# EasyEDA Pro project curtain-lifter.epro, board PCB3
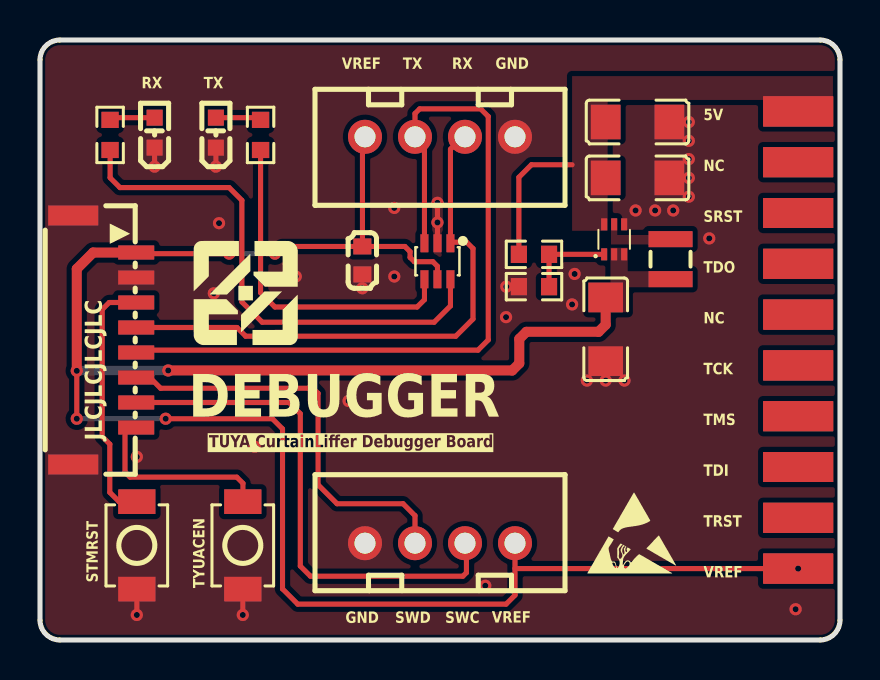
[diagram p6: board, top side]
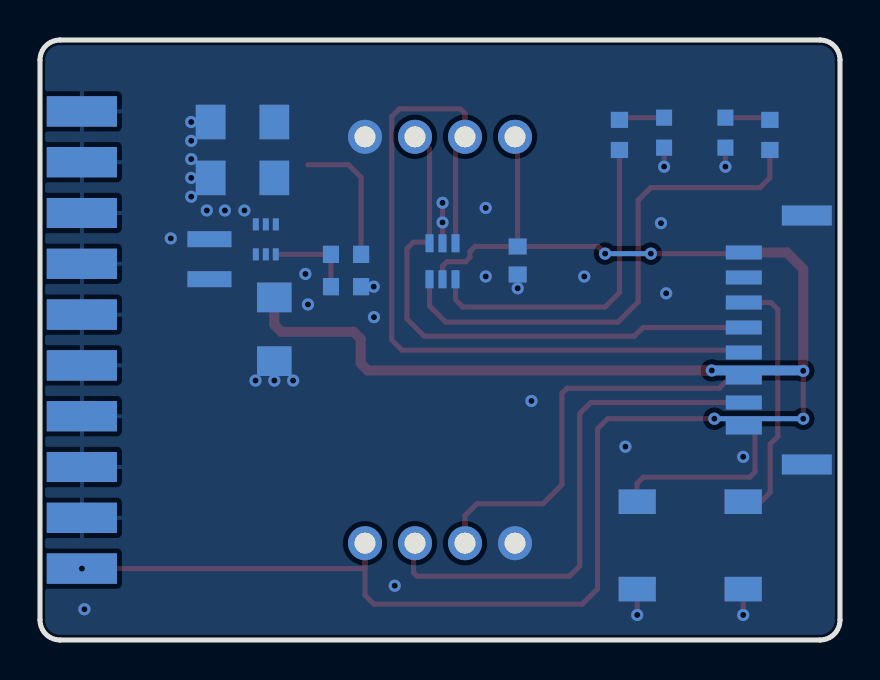
[diagram p7: board, bottom side, seen from below]

Outline 40 x 30 mm; copper layers: Top Layer, Bottom Layer. Coordinates in mm from the lower left corner of the outline.
Outline path: 0,29 0,1 arc(0.29,0.29) 1,0 39,0 arc(39.71,0.29) 40,1 40,29 arc(39.71,29.71) 39,30 1,30 arc(0.29,29.71) 0,29
Stack: Top Layer 0.035mm / Dielectric1 1.51mm FR4 er 4.5 / Bottom Layer 0.035mm

## Design rules (mm)
spacing copperThickness1oz (default): track to track 0.102, other pairs 0.152 to 0.3
spacing copperThickness2oz: track to track 0.203, other pairs 0.152 to 0.3
track width copperThickness1oz (default): min 0.127, default 0.254, max 2.54
track width copperThickness2oz: min 0.203, default 0.254, max 2.54
differential pair differentialPair (default): width min 0.127, default 0.254, max 2.54; gap min 0.152, default 0.152
pour e247 uses copperThickness1oz

## Placement (name value [footprint] x y rotation side)
C1  100nF  [C0603]  16.12 18.98 90 top
C2  10uF  [C1206]  28.28 15.54 270 top
C3  22uF  [C1206]  29.88 25.9 180 top
C24  22uF  [C1206]  29.88 23.11 180 top
CN1  HX-XH2.54-4PZZ  [CONN-TH_4P-P2.50-XH2.54-4P]  20 25.16 0 top
CN2  HX-XH2.54-4PZZ  [CONN-TH_4P-P2.50-XH2.54-4P]  20 4.84 180 top
CN3  SH-SM08B-GHS-TB(LF)(SN)  [CONN-SMD_SH-SM08B-GHS-TB]  3.24 15 270 top
L2  1uH  [IND-SMD_L2.5-W2.0_MHCHL2520]  31.53 19.04 270 top
LED2  XL-1608BGWC-06  [LED-SMD_L1.6-W0.8-RD-BLUE]  8.79 25.37 90 top
LED3  XL-1608BGWC-06  [LED-SMD_L1.6-W0.8-RD-BLUE]  5.73 25.37 90 top
NOREF  -  [Pad_e17]  37.91 6.11 0 top
NOREF#2  -  [Pad_e25]  37.91 18.81 0 top
NOREF#3  -  [Pad_e14]  37.91 13.73 0 top
NOREF#4  -  [Pad_e12]  37.91 18.81 0 top
NOREF#5  -  [Pad_e23]  37.91 26.43 0 top
NOREF#6  -  [Pad_e20]  37.91 6.11 0 top
NOREF#7  -  [Pad_e22]  37.91 3.57 0 top
NOREF#8  -  [Pad_e28]  37.91 11.19 0 top
NOREF#9  -  [Pad_e13]  37.91 16.27 0 top
NOREF#10  -  [Pad_e19]  37.91 13.73 0 top
NOREF#11  -  [Pad_e11]  37.91 21.35 0 top
NOREF#12  -  [Pad_e16]  37.91 8.65 0 top
NOREF#13  -  [Pad_e18]  37.91 3.57 0 top
NOREF#14  -  [Pad_e26]  37.91 21.35 0 top
NOREF#15  -  [Pad_e24]  37.91 16.27 0 top
NOREF#16  -  [Pad_e9]  37.91 26.43 0 top
NOREF#17  -  [Pad_e10]  37.91 23.89 0 top
NOREF#18  -  [Pad_e15]  37.91 11.19 0 top
NOREF#19  -  [Pad_e27]  37.91 23.89 0 top
NOREF#20  -  [Pad_e21]  37.91 8.65 0 top
R1  2kΩ  [R0603]  11.03 25.25 270 top
R2  2kΩ  [R0603]  3.51 25.25 270 top
R3  732kΩ  [R0603]  24.7 19.28 180 top
R4  100kΩ  [R0603]  24.7 17.67 0 top
SW1  TS-1088-AR02016  [SW-SMD_L3.9-W3.0-P4.45]  10.14 4.73 270 top
SW2  TS-1088-AR02016  [SW-SMD_L3.9-W3.0-P4.45]  4.84 4.73 270 top
U1  TPS61023DRLR  [SOT-563_L1.6-W1.2-P0.50-LS1.6-BR]  28.71 20.03 270 top
U8  74LVC2G17GW,125  [SOT-363_L2.0-W1.3-P0.65-LS2.1-BR]  19.87 18.94 90 top

## Footprints (pads in the part's own frame, mm; a bottom-side part is the same pattern mirrored in y, then rotated)
C0603
  rect 0.8x0.9 hole 0.001: 1(-0.7,0) 2(0.7,0)
C1206
  rect 1.485x1.728 hole 0.001: 1(-1.593,0) 2(1.593,0)
CONN-SMD_SH-SM08B-GHS-TB
  rect 0.7x1.8 hole 0.001: 1(-4.375,1.575) 2(-3.125,1.575) 3(-1.875,1.575) 4(-0.625,1.575) 5(0.625,1.575) 6(1.875,1.575) 7(3.125,1.575) 8(4.375,1.575)
  rect 1x2.5 hole 0.001: 9(6.225,-1.575) 10(-6.225,-1.575)
CONN-TH_4P-P2.50-XH2.54-4P
  round 1.7 hole 1.05: 1(3.75,0) 2(1.25,0) 3(-1.25,0) 4(-3.75,0)
IND-SMD_L2.5-W2.0_MHCHL2520
  rect 0.8x2.2 hole 0.001: 1(-1,0) 2(1,0)
LED-SMD_L1.6-W0.8-RD-BLUE
  rect 0.8x0.8 hole 0.001: 1(-0.75,0) 2(0.75,0)
Pad_e9
  rect 3.5x1.5 hole 0.001: 1(0,0)
Pad_e10
  rect 3.5x1.5 hole 0.001: 1(0,0)
Pad_e11
  rect 3.5x1.5 hole 0.001: 1(0,0)
Pad_e12
  rect 3.5x1.5 hole 0.001: 1(0,0)
Pad_e13
  rect 3.5x1.5 hole 0.001: 1(0,0)
Pad_e14
  rect 3.5x1.5 hole 0.001: 1(0,0)
Pad_e15
  rect 3.5x1.5 hole 0.001: 1(0,0)
Pad_e16
  rect 3.5x1.5 hole 0.001: 1(0,0)
Pad_e17
  rect 3.5x1.5 hole 0.001: 1(0,0)
Pad_e18
  rect 3.5x1.5 hole 0.001: 1(0,0)
Pad_e19
  rect 3.5x1.5 hole 0.001: 1(0,0)
Pad_e20
  rect 3.5x1.5 hole 0.001: 1(0,0)
Pad_e21
  rect 3.5x1.5 hole 0.001: 1(0,0)
Pad_e22
  rect 3.5x1.5 hole 0.001: 1(0,0)
Pad_e23
  rect 3.5x1.5 hole 0.001: 1(0,0)
Pad_e24
  rect 3.5x1.5 hole 0.001: 1(0,0)
Pad_e25
  rect 3.5x1.5 hole 0.001: 1(0,0)
Pad_e26
  rect 3.5x1.5 hole 0.001: 1(0,0)
Pad_e27
  rect 3.5x1.5 hole 0.001: 1(0,0)
Pad_e28
  rect 3.5x1.5 hole 0.001: 1(0,0)
R0603
  rect 0.806x0.864 hole 0.001: 1(-0.753,0) 2(0.753,0)
SOT-363_L2.0-W1.3-P0.65-LS2.1-BR
  rect 0.9x0.4 hole 0.001: 1(0.9,-0.65) 2(0.9,0) 3(0.9,0.65) 4(-0.9,0.65) 5(-0.9,0) 6(-0.9,-0.65)
SOT-563_L1.6-W1.2-P0.50-LS1.6-BR
  rect 0.6x0.3 hole 0.001: 1(0.75,-0.5) 2(0.75,0) 3(0.75,0.5) 4(-0.75,0.5) 5(-0.75,0) 6(-0.75,-0.5)
SW-SMD_L3.9-W3.0-P4.45
  rect 1.23x1.86 hole 0.001: 1(-2.185,0) 2(2.185,0)

## Nets
As in the schematic, except:
3V3: C1.2 C2.1 CN1.4 CN2.4 CN3.1 L2.2 NOREF#7.1 NOREF#13.1 U1.2 U1.3 U8.5
5V_DEBUG: C3.2 C24.2 NOREF#16.1 R3.2 U1.6
GND: C1.1 C2.2 C3.1 C24.1 CN1.1 CN2.1 CN3.2 CN3.9 CN3.10 LED2.1 LED3.1 NOREF#2.1 NOREF#5.1 NOREF#6.1 NOREF#8.1 NOREF#10.1 NOREF#14.1 NOREF#15.1 NOREF#19.1 NOREF#20.1 R4.1 SW1.2 SW2.2 U1.4 U8.2

Pads without a net: NOREF#9 1; NOREF#17 1

## Via types
v1: diameter 0.61, hole 0.305, Top Layer to Bottom Layer, 40 vias

## Routing (per net, layer and track width the routed paths; a pad name or vN(x,y) marks a point on that pad's centre or on a via; arc(x,y) is an arc through that point)
3V3: length 109.7
  Top Layer w0.254: v1(11.75,19.32) 12.1,19.68 C1.2 18.24,19.68 18.5,19.42 18.5,19.13 18.72,18.92 19.64,18.92 19.87,18.69 U8.5 ; 23.75,3.57 23.75,2.24 23.3,1.79 12.89,1.79 12.13,2.55 12.13,10.56 11.62,11.06 v1(6.28,11.06) ; 23.75,3.57 v1(37.91,3.57) ; 23.75,3.57 CN2.4 ; 16.12,25.3 16.12,19.68 ; v1(1.84,11.06) v1(1.84,13.46) ; v1(9.46,19.32) 4.87,19.32 4.81,19.38
  Top Layer w0.5: 4.81,19.38 2.66,19.38 1.84,18.56 v1(1.84,13.46) ; C2.1 28.28,15.76 27.93,15.41 24.32,15.41 23.96,15.06 23.96,13.83 23.61,13.48 v1(6.41,13.48)
  Bottom Layer w0.254: v1(11.75,19.32) v1(9.46,19.32) ; v1(6.28,11.06) v1(1.84,11.06)
  Bottom Layer w0.5: v1(6.41,13.48) 1.84,13.48
5V_DEBUG: length 6.4
  Top Layer w0.254: 26.6,23.76 24.57,23.76 23.95,23.14 23.95,19.7
GND: length 6.7
  Top Layer w0.254: U8.2 v1(19.87,20.88) v1(19.87,21.86) ; 10.14,1.26 10.14,1.25 ; 10.14,2.66 10.14,1.26 ; LED3.1 v1(5.73,23.67) ; LED2.1 v1(8.79,23.67) ; 4.84,2.66 v1(4.84,1.25)
  vias: v1(4.84,9.16) v1(8.69,17.33) v1(8.95,20.84) v1(10.14,1.25) v1(10.73,9.67) v1(12.79,18.17) v1(15.43,11.95) v1(16.12,17.59) v1(17.71,21.6) v1(17.71,18.17) v1(22.26,2.71) v1(23.31,17.67) v1(23.3,16.14) v1(26.6,16.78) v1(26.73,18.3) v1(27.34,12.97) v1(28.28,12.97) v1(29.22,12.97) v1(29.78,21.48) v1(30.76,21.48) v1(31.66,21.48) v1(32.44,25.9) v1(32.44,24.96) v1(32.44,24.05) v1(32.44,23.11) v1(32.44,22.17) v1(33.46,20.08) v1(37.78,1.54)
BOOST_FB: length 4.4
  Top Layer w0.254: U1.1 R3.1 R4.2
DEBUG_RX: length 39.6
  Top Layer w0.254: 19.22,19.84 19.22,24.69 CN1.3 18.75,26.32 18.98,26.56 22.03,26.56 22.41,26.18 22.41,15 21.9,14.49 4.93,14.49 4.81,14.38
DEBUG_TX: length 27.9
  Top Layer w0.254: CN1.2 21.14,25.16 20.52,24.54 U8.1 20.58,19.89 21.33,19.89 21.65,19.57 21.65,16.05 20.79,15.19 10.28,15.19 9.85,15.62 4.81,15.62
MCU_NRST: length 12.7
  Top Layer w0.254: SW2.1 3.96,6.92 3.49,7.38 3.49,9.79 3.11,10.17 3.11,16.52 3.46,16.88 4.81,16.88
STM_SWC: length 26.1
  Top Layer w0.254: CN2.3 21.32,4.77 21.32,3.37 21.14,3.19 13.52,3.19 13.01,3.7 13.01,11.32 12.46,11.88 4.81,11.88
STM_SWD: length 20.9
  Top Layer w0.254: 4.81,13.12 5.49,13.12 6.03,12.59 13.65,12.59 13.9,12.33 13.9,7.76 14.85,6.81 18.15,6.81 18.75,6.22 CN2.2
TUYA_CEN: length 9.8
  Top Layer w0.254: SW1.1 10.15,6.92 10.15,7.84 9.84,8.14 4.51,8.14 4.25,8.4 4.25,10.56 4.32,10.62 4.81,10.62
$1N39: length 26
  Top Layer w0.254: R2.2 3.51,23.11 4,22.62 9.46,22.62 10.09,21.98 10.09,16.91 11.11,15.89 19.71,15.89 20.52,16.7 U8.6
$1N40: length 16.8
  Top Layer w0.254: R1.2 11.03,17.37 11.75,16.65 18.86,16.65 19.22,17.02 19.22,18.04
$1N49: length 2.3
  Top Layer w0.254: LED2.2 10.92,26.12 11.03,26.01
$1N50: length 2.3
  Top Layer w0.254: LED3.2 3.62,26.12 3.51,26.01

## Copper pours and planes (outline as drawn; the poured copper is in the pictures)
3V3 on Top Layer: 28.52,19.61 29.39,19.61 29.39,16.39 28.52,16.39
3V3 on Top Layer: 28.81,18.44 32.63,18.44 32.63,17.64 28.81,17.64
5V_DEBUG on Top Layer: 26.6,28.19 39.65,28.19 39.65,20.46 26.6,20.46
GND on Top Layer: 0,30 40,30 40,0 0,0
GND on Bottom Layer: 0,30 40,30 40,0 0,0
BOOST_SW on Top Layer: 28.55,21.09 32.63,21.09 32.63,19.78 28.55,19.78

## Text on the board
Top Silkscreen Layer: RX | TX | VREF | GND | SWD | SWC | 5V | NC | SRST | TDO | TCK | TMS | TDI | TRST | STMRST | TYUACEN | TUYA CurtainLiffer Debugger Board | JLCJLCJLCJLC | DEBUGGER
